# Altium schematic sheet Actuator_Section2.SchDoc
size A; DocumentNumber: 11; SheetNumber: 11; SheetTotal: 13
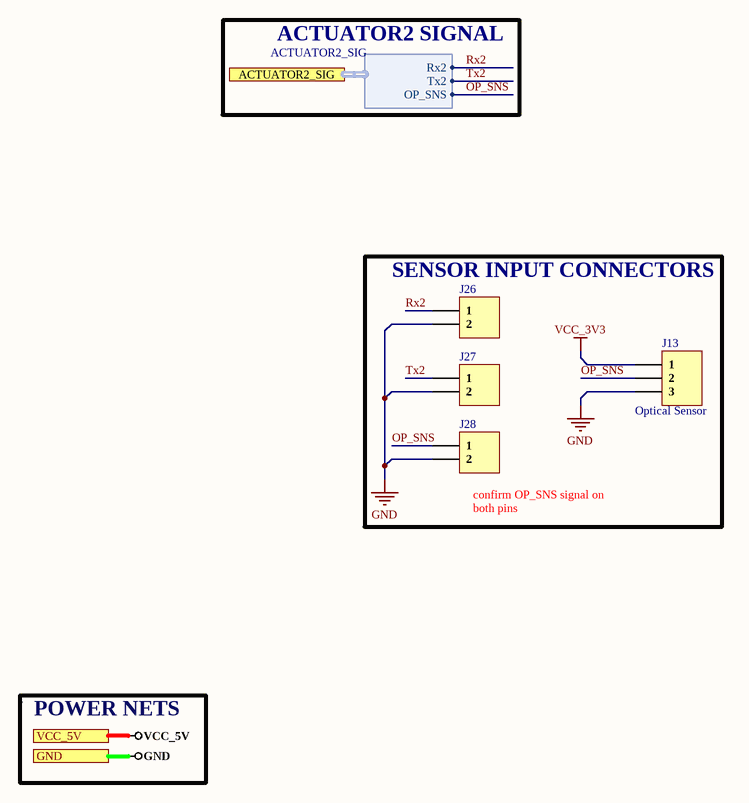
[diagram p0: Actuator_Section2.SchDoc]

## Parts
J13  Optical Sensor  [B3B-XH-A(LF)(SN)]
J26  B2B-XH-A(LF)(SN)  [B2B-XH-A(LF)(SN)]  (value not drawn)
J27  B2B-XH-A(LF)(SN)  [B2B-XH-A(LF)(SN)]  (value not drawn)
J28  B2B-XH-A(LF)(SN)  [B2B-XH-A(LF)(SN)]  (value not drawn)

## Blocks framed on the sheet
SENSOR INPUT CONNECTORS: J13 J26-J28

## Ports
ACTUATOR2_SIG (harness ACTUATOR2_SIG), GND, VCC_5V

## Harnesses
ACTUATOR2_SIG: Rx2, Tx2, OP_SNS

## Nets
GND: J13.3 J26.2 J27.2 J28.2 ; port GND
VCC_3V3: J13.1
VCC_5V: port VCC_5V
OP_SNS: J13.2 J28.1 ; port ACTUATOR2_SIG.OP_SNS
Rx2: J26.1 ; port ACTUATOR2_SIG.Rx2
Tx2: J27.1 ; port ACTUATOR2_SIG.Tx2

## Notes on the sheet
- ACTUATOR2 SIGNAL
- (near J28) confirm OP_SNS signal on both pins
- POWER NETS

## Library data of the parts
J13 = B3B-XH-A(LF)(SN): CONN HEADER VERT 3POS 2.5MM; Manufacturer: JST; Current Rating: 3A; Number of Positions: 3; Voltage Rating (AC): 250V; Contact Resistance: 20mR; Insulation Resistance: 1GR; Gender: Male; Wire/Cable Gauge: 22AWG; Supplier 1: Digi-Key; Manufacturer Part Number: B3B-XH-A(LF)(SN); Stock 1: 3453; Pricing 1: 1=0.19, 10=0.181, 25=0.1344, 50=0.1154, 250=0.09612, 750=0.08652, 1000=0.08075, 12000=0.06152, 24000=0.05575 (USD); Mount: Through Hole; Contact Plating: Tin,Lead,Copper; Contact Material: Brass; Color: Natural; Housing Color: White; Housing Material: Polyamide; Contact Shape: Square; Contact Finish - Mating: TIN; Insulation Material: Nylon; Insulation Color: Natural; Min Operating Temperature: -25°C; Max Operating Temperature: 85°C; Number of Rows: 1; Packaging: Bulk; Termination: Solder; Connector Type: Header; Series: XH; Contact Type: Male Pin; Max Current Rating: 3A; Voltage Rating: 250V; Fastening Type: Detent; Number of Contacts: 3; Max Voltage Rating (AC): 250V; Max Voltage Rating (DC): 250V; Orientation: Straight; Length: 9.9mm; Pitch: 2.5mm; Lead Pitch: 2.5mm; Depth: 5.75mm; Lead Free: Lead Free; REACH SVHC: No SVHC; Flammability Rating: UL94 V-0; ComponentLink1URL: https://www.verical.com/server-webapp/html/getDatasheet?partID=640434&src-supplier=Verical; ComponentLink1Description: https://www.verical.com/server-webapp/html/getDatasheet?partID=640434&src-supplier=Verical; ComponentLink2URL: https://www.verical.com/server-webapp/html/getDatasheet?partID=440399&src-supplier=Verical; ComponentLink2Description: https://www.verical.com/server-webapp/html/getDatasheet?partID=440399&src-supplier=Verical; Supplier Part Number 1: 455-2248-ND
J26-J28 = B2B-XH-A(LF)(SN): Conn Shrouded Header (4 Sides) HDR 2 POS 2.5mm Solder ST Thru-Hole Box; Manufacturer: JST; Number of Positions: 2; Connector Type: Male Pin; Current Rating: 3A; Contact Resistance: 20mR; Voltage Rating: 250V; Insulation Resistance: 1GR; Wire/Cable Gauge: 22AWG; Supplier 1: Farnell; Manufacturer Part Number: B2B-XH-A(LF)(SN); RoHS: Yes; Category: FFC / FPC; Stock 1: 219240; Pricing 1: 100=0.06860, 1000=0.04800, 2500=0.04520, 5000=0.04230, 10000=0.03950, 20000=0.03660 (GBP); Mount: Through Hole; Contact Plating: Tin,Copper,Lead; Color: Natural; Contact Material: Brass; Housing Color: White; Housing Material: Polyamide; Min Operating Temperature: -25°C; Max Operating Temperature: 85°C; Number of Rows: 1; Packaging: Bulk; Termination: Solder; Fastening Type: Detent; Max Current Rating: 3A; Voltage Rating (AC): 250V; Max Voltage Rating (AC): 250V; Number of Contacts: 2; Max Voltage Rating (DC): 250V; Orientation: Straight; Length: 7.4mm; Pitch: 2.5mm; Lead Pitch: 2.5mm; Depth: 5.75mm; REACH SVHC: No SVHC; Lead Free: Lead Free; ComponentLink1URL: https://datasheet.ciiva.com/26894/getdatasheetpartid-640357-26894434.pdf?src-supplier=Verical; ComponentLink1Description: https://datasheet.ciiva.com/26894/getdatasheetpartid-640357-26894434.pdf?src-supplier=Verical; ComponentLink2URL: https://datasheet.ciiva.com/11746/0900766b8082653e-11746979.pdf?src-supplier=RSComponents; ComponentLink2Description: https://datasheet.ciiva.com/11746/0900766b8082653e-11746979.pdf?src-supplier=RSComponents; ComponentLink3URL: https://datasheet.ciiva.com/26894/getdatasheetpartid-385291-26894760.pdf?src-supplier=Verical; ComponentLink3Description: https://datasheet.ciiva.com/26894/getdatasheetpartid-385291-26894760.pdf?src-supplier=Verical; ComponentLink4URL: https://datasheet.ciiva.com/8052/5448-8052024.pdf?src-supplier=Element14; ComponentLink4Description: https://datasheet.ciiva.com/8052/5448-8052024.pdf?src-supplier=Element14; ComponentLink5URL: https://datasheet.ciiva.com/20207/523653-20207167.pdf?src-supplier=Rapid+Electronics; ComponentLink5Description: https://datasheet.ciiva.com/20207/523653-20207167.pdf?src-supplier=Rapid+Electronics; Supplier Part Number 1: 1516276